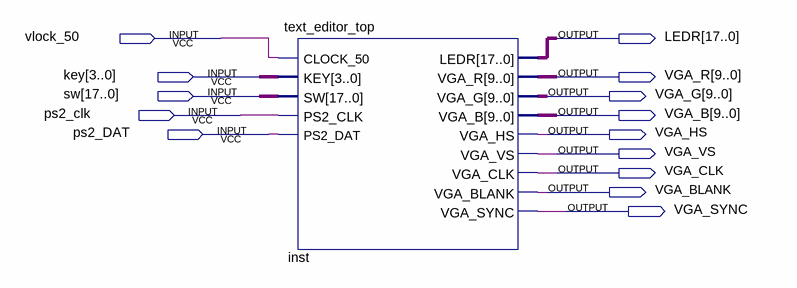
[diagram p0: schematic sheet]
// Quartus schematic text_editor_top_bdf_bdf.bdf as structural Verilog: 1 symbols, 14 pins
module text_editor_top_bdf_bdf (
  input  vlock_50,
  input  [3:0] key,
  input  [17:0] sw,
  input  ps2_clk,
  input  ps2_DAT,
  output [17:0] LEDR,
  output [9:0] VGA_R,
  output [9:0] VGA_G,
  output [9:0] VGA_B,
  output VGA_HS,
  output VGA_VS,
  output VGA_CLK,
  output VGA_BLANK,
  output VGA_SYNC
);

  text_editor_top inst (
    .CLOCK_50(vlock_50), .KEY(key), .SW(sw), .PS2_CLK(ps2_clk), .PS2_DAT(ps2_DAT), .LEDR(LEDR),
    .VGA_R(VGA_R), .VGA_G(VGA_G), .VGA_B(VGA_B), .VGA_HS(VGA_HS), .VGA_VS(VGA_VS), .VGA_CLK(VGA_CLK),
    .VGA_BLANK(VGA_BLANK), .VGA_SYNC(VGA_SYNC));
endmodule
